# EAGLE schematic demo-eagle (EAGLE 9.6.2)

## Sheet 1 of 2
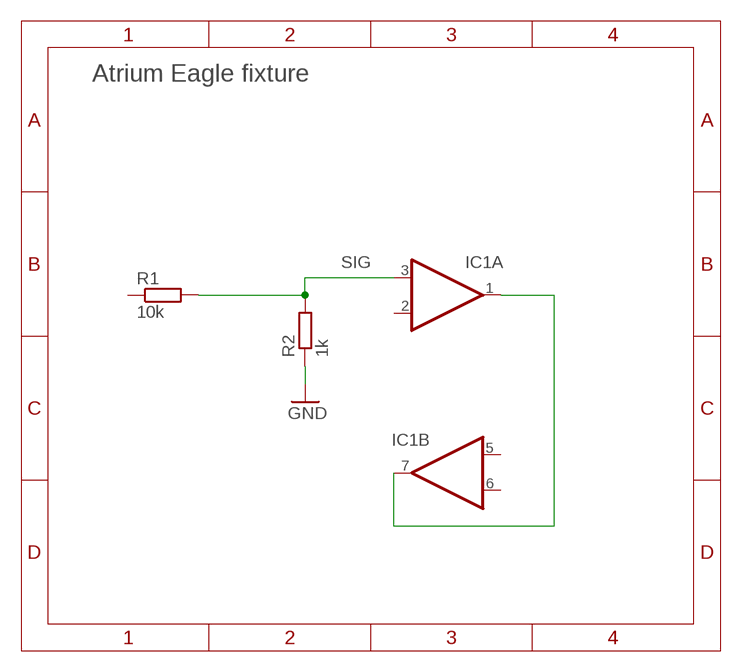
[diagram p0: schematic, sheet 1]

### Parts
IC1  DUALAMPD  [SO8]
R1  10k  R0603  [R0603]
R2  1k  R0603  [R0603]

### Nets
GND: R2.1
N$1: IC1.1(A:OUT) IC1.7(B:OUT)
SIG: IC1.3(A:+IN) R1.2 R2.2 ; also sheet 2
Unconnected: IC1.2(A:-IN) IC1.5(B:+IN) IC1.6(B:-IN) R1.1

### Notes on the sheet
- Atrium Eagle fixture

## Sheet 2 of 2
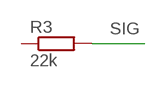
[diagram p1: schematic, sheet 2]

### Parts
R3  22k  R0603  [R0603]

### Nets
SIG: R3.2 ; also sheet 1
Unconnected: R3.1

## Library data of the parts
IC1 = atrium-test:DUALAMP
R1-R3 = atrium-test:R